# EasyEDA Pro project RUSH_PCB_nova_com_cobre.epro, board PCB1
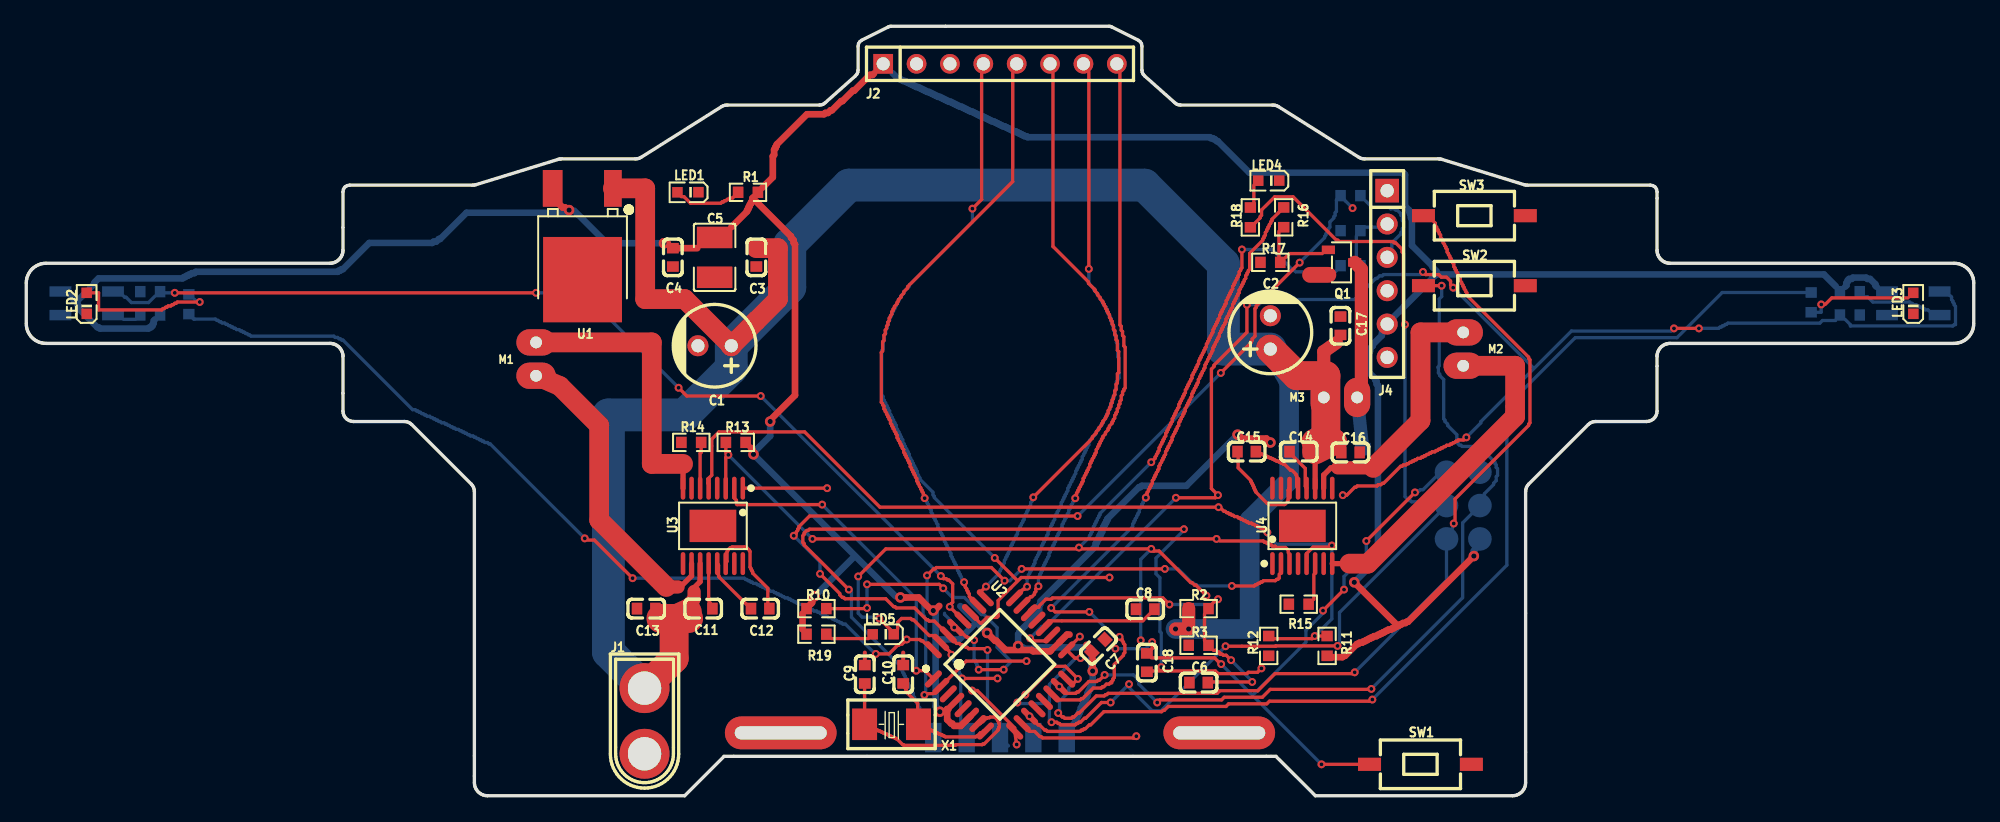
[diagram p1: board, top side]
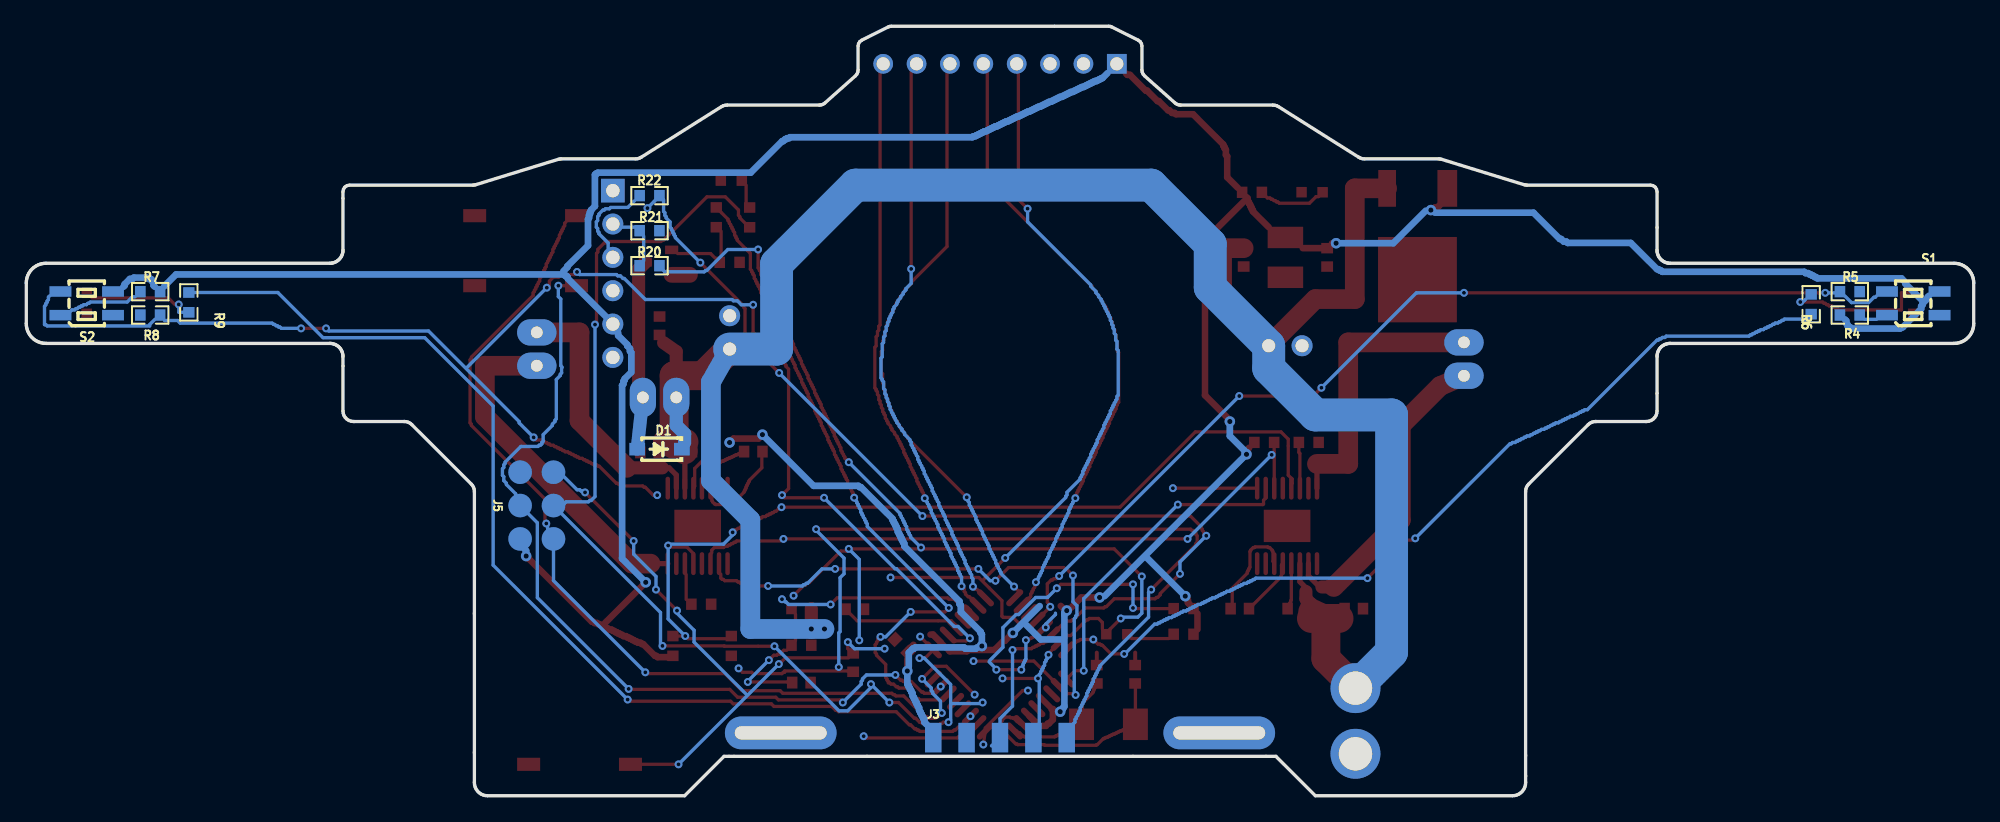
[diagram p2: board, bottom side, seen from below]

Outline 148.2 x 58.6 mm; copper layers: Top Layer, Bottom Layer. Coordinates in mm from the lower left corner of the outline.
Stack: Top Layer 0.035mm / Dielectric1 1.51mm FR4 er 4.5 / Bottom Layer 0.035mm

## Design rules (mm)
spacing copperThickness1oz (default): track to track 0.2, other pairs 0.2 to 0.3
spacing copperThickness2oz: track to track 0.203, other pairs 0.152 to 0.3
spacing Plane_innerPlane: track to track 0.102, other pairs 0.152 to 0.3
spacing Copper_copperRegion: track to track 0.102, other pairs 0.152 to 0.3
track width copperThickness1oz (default): min 0.25, default 0.25, max 3
track width copperThickness2oz: min 0.203, default 0.254, max 2.54
differential pair differentialPair (default): width min 0.127, default 0.254, max 2.54; gap min 0.152, default 0.152

## Placement (name value [footprint] x y rotation side)
C1  220uF  [CAP-TH_BD6.3-P2.50-D1.0-FD]  52.38 34.27 180 top
C2  220uF  [CAP-TH_BD6.3-P2.50-D1.0-FD]  94.67 35.29 90 top
C3  220nF  [C0603]  55.56 41 270 top
C4  100nF  [C0603]  49.2 41 270 top
C5  47uF  [C1210]  52.38 41 90 top
C6  100nF  [C0603]  89.21 8.62 180 top
C7  100nF  [C0603]  81.59 11.41 45 top
C8  100nF  [C0603]  85.15 14.2 180 top
C9  22pF  [C0603]  63.81 9.25 90 top
C10  22pF  [C0603]  66.73 9.25 90 top
C11  100nF  [C0603]  51.51 14.25 0 top
C12  22nF  [C0603]  55.85 14.25 0 top
C13  100nF  [C0603]  47.18 14.25 180 top
C14  100nF  [C0603]  96.83 26.21 180 top
C15  22nF  [C0603]  92.87 26.21 180 top
C16  100nF  [C0603]  100.77 26.14 0 top
C17  100nF  [C0603]  100.01 35.79 90 top
C18  100nF  [C0603]  85.28 10.14 90 top
D1  1N5819  [SOD-123_L2.7-W1.6-LS3.7-RD-1]  100.01 26.4 0 bottom
J1  XT30 (bateria 2S)  [CONN-TH_XT30U-M]  47.05 5.69 270 top
J2  BARRA (1x8, 2,54 mm)  [HDR-TH_8P-P2.54-V-M]  74.1 55.74 0 top
J3  GRAVAÇÃO  [seguidor_alpha:HDR_1x05_P2.54_SMD_DEITADA]  74.1 4.43 0 bottom
J4  BLUETOOTH (femea 1x6, ordem HC-05)  [HDR-TH_6P-P2.54-V-F]  103.56 39.73 270 top
J5  ICSP  [seguidor_alpha:ICSP_6P_SMD_BOT]  109.35 22.1 0 bottom
LED1  verde  [LED0603-RD_GREEN]  50.35 45.96 180 top
LED2  LED A  [LED0603-RD_GREEN]  4.6 37.5 90 top
LED3  LED B  [LED0603-RD_GREEN]  143.6 37.5 90 top
LED4  LED C  [LED0603-RD_GREEN]  94.55 46.84 180 top
LED5  TX  [LED0603-RD_GREEN]  65.21 12.3 180 top
M1  1020 esq.  [seguidor_alpha:MOTOR_1020_2P]  38.79 33.25 0 top
M2  1020 dir.  [seguidor_alpha:MOTOR_1020_2P]  109.35 34.02 180 top
M3  ventoinha  [seguidor_alpha:MOTOR_1020_2P]  100.01 30.33 270 top
NOREF  -  [Pad_e557]  90.78 4.79 270 top
NOREF#2  -  [Pad_e558]  57.41 4.79 270 top
Q1  AO3400A  [SOT-23-3_L2.9-W1.3-P1.90-LS2.4-BR]  100.09 40.62 180 top
R1  1k  [R0603]  54.92 45.95 180 top
R2  20k 1%  [R0603]  89.21 14.25 0 top
R3  10k 1%  [R0603]  89.21 11.46 180 top
R4  220  [R0603]  9.43 36.61 180 bottom
R5  47k  [R0603]  9.43 38.39 180 bottom
R6  1k  [R0603]  12.37 37.43 90 bottom
R7  220  [R0603]  138.77 38.39 0 bottom
R8  47k  [R0603]  138.77 36.61 0 bottom
R9  1k  [R0603]  135.83 37.57 270 bottom
R10  10k  [R0603]  60.13 14.25 0 top
R11  15k 1%  [R0603]  98.99 11.41 90 top
R12  10k 1%  [R0603]  94.55 11.41 270 top
R13  10k  [R0603]  53.99 26.91 180 top
R14  1.5k 1%  [R0603]  50.6 26.91 180 top
R15  1.5k 1%  [R0603]  96.83 14.58 180 top
R16  200  [R0603]  95.69 44.05 270 top
R17  10k  [R0603]  94.67 40.62 180 top
R18  1k  [R0603]  93.15 44.04 90 top
R19  1k  [R0603]  60.13 12.3 0 top
R20  1k  [R0603]  100.77 40.37 0 bottom
R21  2k  [R0603]  100.77 43.03 180 bottom
R22  4.7k  [R0603]  100.77 45.7 0 bottom
S1  QRE1113GR  [OPTO-SMD_QRE1113GR]  4.6 37.5 180 bottom
S2  QRE1113GR  [OPTO-SMD_QRE1113GR]  143.6 37.5 180 bottom
SW1  RESET  [KEY-SMD_L6.1-W3.7-LS8.0-2]  106.1 2.39 180 top
SW2  BOTÃO 1  [KEY-SMD_L6.1-W3.7-LS8.0-2]  110.2 38.84 0 top
SW3  BOTÃO 2  [KEY-SMD_L6.1-W3.7-LS8.0-2]  110.2 44.18 0 top
U1  78M05  [TO-252-2_L6.5-W6.1-P4.58-LS10.0-TL]  42.35 42.78 270 top
U2  ATmega328P-AU  [TQFP-32_L7.0-W7.0-P0.80-LS9.0-BL]  74.1 10 315 top
U3  DRV8874PWPR  [HTSSOP-16_L5.0-W4.4-P0.65-LS6.4-BL-EP]  52.25 20.55 180 top
U4  DRV8874PWPR  [HTSSOP-16_L5.0-W4.4-P0.65-LS6.4-BL-EP]  97.11 20.55 0 top
X1  16MHz  [CRYSTAL-SMD_L5.0-W3.2]  65.84 5.44 0 top

## Footprints (pads in the part's own frame, mm; a bottom-side part is the same pattern mirrored in y, then rotated)
C0603
  rect 0.8x0.9 smd: 1(-0.7,0) 2(0.7,0)
C1210
  rect 1.635x2.7 smd: 1(-1.518,0) 2(1.518,0)
CAP-TH_BD6.3-P2.50-D1.0-FD
  round 1.6 hole 1: 1(-1.27,0) 2(1.27,0)
CONN-TH_XT30U-M
  round 3.8 hole 2.54: 1(-2.5,0) 2(2.5,0)
CRYSTAL-SMD_L5.0-W3.2
  rect 1.9x2.4 smd: 1(-2.05,0) 2(2.05,0)
HDR-TH_6P-P2.54-V-F
  rect 1.8x1.8 hole 1.02: 1(-6.35,0)
  round 1.6 hole 1.02: 2(-3.81,0) 3(-1.27,0) 4(1.27,0) 5(3.81,0) 6(6.35,0)
HDR-TH_8P-P2.54-V-M
  rect 1.5x1.5 hole 1: 1(-8.89,0)
  round 1.5 hole 1: 2(-6.35,0) 3(-3.81,0) 4(-1.27,0) 5(1.27,0) 6(3.81,0) 7(6.35,0) 8(8.89,0)
HTSSOP-16_L5.0-W4.4-P0.65-LS6.4-BL-EP
  oval 0.343x1.746 smd: 1(-2.275,-2.873) 2(-1.625,-2.873) 3(-0.975,-2.873) 4(-0.325,-2.873) 5(0.325,-2.873) 6(0.975,-2.873) 7(1.625,-2.873) 8(2.275,-2.873) 9(2.275,2.873) 10(1.625,2.873) 11(0.975,2.873) 12(0.325,2.873) 13(-0.325,2.873) 14(-0.975,2.873) 15(-1.625,2.873) 16(-2.275,2.873)
  rect 3.55x2.46 smd: 17(0,0)
KEY-SMD_L6.1-W3.7-LS8.0-2
  rect 1.75x1 smd: 1(-3.875,0) 2(3.875,0)
LED0603-RD_GREEN
  rect 0.8x0.8 smd: 1(-0.799,-0.004) 2(0.799,0.004)
OPTO-SMD_QRE1113GR
  rect 1.66x0.8 smd: 1(-2,-0.9) 2(2,-0.9) 3(2,0.9) 4(-2,0.9)
Pad_e557
  oval 2.5x8.5 hole 1x7: 1(0,0)
Pad_e558
  oval 2.5x8.5 hole 1x7: 1(0,0)
R0603
  rect 0.806x0.864 smd: 1(-0.753,0) 2(0.753,0)
seguidor_alpha:HDR_1x05_P2.54_SMD_DEITADA
  rect 1.25x2.25 smd: 1(5.08,0) 2(2.54,0) 3(0,0) 4(-2.54,0) 5(-5.08,0)
seguidor_alpha:ICSP_6P_SMD_BOT
  round 1.8 smd: 1(-1.27,2.54) 2(1.27,2.54) 3(-1.27,0) 4(1.27,0) 5(-1.27,-2.54) 6(1.27,-2.54)
seguidor_alpha:MOTOR_1020_2P
  oval 3x2 hole 0.9: 1(0,-1.27) 2(0,1.27)
SOD-123_L2.7-W1.6-LS3.7-RD-1
  rect 1.2x0.95 smd: 1(-1.7,0) 2(1.7,0)
SOT-23-3_L2.9-W1.3-P1.90-LS2.4-BR
  rect 1x0.65 smd: 1(1,-0.95) 2(1,0.95) 3(-1,0)
TO-252-2_L6.5-W6.1-P4.58-LS10.0-TL
  rect 2.8x1.35 smd: 1(-3.475,2.29)
  rect 6.5x6 smd: 2(3.475,-0.017)
  rect 2.8x1.5 smd: 3(-3.475,-2.29)
TQFP-32_L7.0-W7.0-P0.80-LS9.0-BL
  oval 0.45x1.65 smd: 1(-2.8,-4.369) 2(-2,-4.369) 3(-1.2,-4.369) 4(-0.4,-4.369) 5(0.4,-4.369) 6(1.2,-4.369) 7(2,-4.369) 8(2.8,-4.369) 17(2.8,4.369) 18(2,4.369) 19(1.2,4.369) 20(0.4,4.369) 21(-0.4,4.369) 22(-1.2,4.369) 23(-2,4.369) 24(-2.8,4.369)
  oval 1.65x0.45 smd: 9(4.381,-2.8) 10(4.381,-2) 11(4.381,-1.2) 12(4.381,-0.4) 13(4.381,0.4) 14(4.381,1.2) 15(4.381,2) 16(4.381,2.8) 25(-4.381,2.8) 26(-4.381,2) 27(-4.381,1.2) 28(-4.381,0.4) 29(-4.381,-0.4) 30(-4.381,-1.2) 31(-4.381,-2) 32(-4.381,-2.8)

## Nets
As in the schematic.

Pads without a net: J2 3; J4 1 6; NOREF 1; NOREF#2 1; U2 12 13; U3 4; U4 4

## Via types
v1: diameter 0.8, hole 0.4, Top Layer to Bottom Layer, 17 vias
v2: diameter 0.6, hole 0.3, Top Layer to Bottom Layer, 119 vias

## Routing (per net, layer and track width the routed paths; a pad name or vN(x,y) marks a point on that pad's centre or on a via; arc(x,y) is an arc through that point)
+5V: length 317.5
  Top Layer w0.5: 79.39,12.27 79.2,12.27 U2.18 ; 78.02,11.1 77.92,11 76.62,11 76.52,11.1 74.52,11.1 73.82,11.8 73.72,11.8 v1(73.12,12.4) ; 70.59,5.32 71.11,5.32 U2.6 ; 49.55,41.7 51.05,41.7 ; 70.18,6.6 70.08,6.6 70.08,5.8 70.38,5.5 70.48,5.5 ; v1(110.16,18.25) 105.16,13.25 105.06,13.25 104.96,13.15 104.76,13.15 104.66,13.05 104.56,13.05 104.46,12.95 104.36,12.95 104.26,12.85 104.16,12.85 104.06,12.75 103.96,12.75 103.86,12.65 103.66,12.65 103.56,12.55 103.46,12.55 103.36,12.45 103.26,12.45 103.16,12.35 103.06,12.35 102.96,12.25 102.86,12.25 102.76,12.15 102.56,12.15 102.46,12.05 102.36,12.05 102.26,11.95 102.16,11.95 102.06,11.85 101.96,11.85 101.86,11.75 101.76,11.75 101.66,11.65 101.46,11.65 101.36,11.55 101.26,11.55 100.36,10.65 100.26,10.65 100.16,10.55 99.09,10.55 R11.1 ; 56.8,28.8 58.5,30.5 58.5,42 58.4,42.1 58.4,42.3 58.2,42.5 58.2,42.6 55.5,45.3 ; v1(94.68,26.9) 94.38,27.2 92.48,27.2 v1(92.18,27.5) ; 55.35,45.6 55.25,45.5 55.25,45.3 55.16,45.2 55.16,45.1 55.06,45 55.06,44.9 54.95,44.8 54.95,44.7 54.85,44.6 54.85,44.5 53.66,43.3 ; C7.1 81.1,11.08 80.69,11.49 ; 68.71,14.3 67.91,15.1 v1(66.52,15.1) ; U1.3 40.06,45.55 40.81,44.8 41.01,44.8 41.11,44.7 41.21,44.7 v1(41.31,44.6) ; 59.07,13.87 59.07,12.67 ; 69.47,14.45 69.12,14.1 v1(69.02,14.1) ; 81.15,10.4 v1(81.15,9.5) ; v1(101.06,16.25) 104.16,13.15 ; v1(55.34,26) 55.34,26.1 55.24,26.2 55.24,26.4 55.14,26.5 ; R10.1 59.38,14.28 59.8,14.7 59.8,14.9 59.9,15 59.9,15.1 v1(60,15.2) ; 48.82,42.08 v1(48.52,42.08) ; 64.51,55 64.41,54.9 64.21,54.9 63.01,53.7 62.91,53.7 62.11,52.9 62.01,52.9 61.31,52.2 61.21,52.2 61.01,52 60.81,52 60.71,51.9 59.41,51.9 57.11,49.6 57.11,49.5 57.01,49.4 57.01,49.3 56.91,49.2 56.91,48.8 56.81,48.7 56.81,47.1 56.01,46.3
  Bottom Layer w0.5: 41,44.4 33.5,44.4 31.5,42.4 31.4,42.4 31.2,42.2 31,42.2 30.9,42.1 26.1,42.1 24.1,40.1 24,40.1 23.9,40 23.8,40 23.7,39.9 12.9,39.9 12.8,39.8 12.6,39.8 12.5,39.7 12.4,39.7 12.3,39.6 12.2,39.6 12.1,39.5 12,39.5 11.9,39.4 5.5,39.4 5.2,39.1 5.2,39 4,37.8 ; J3.1 79.18,4.93 79.85,5.6 79.85,5.8 79.95,5.9 79.95,6 80.05,6.1 80.05,6.2 80.15,6.3 80.15,6.4 80.25,6.5 80.25,6.7 80.35,6.8 80.35,6.9 80.45,7 80.45,7.1 80.55,7.2 80.55,7.3 80.65,7.4 80.65,7.5 80.75,7.6 80.75,7.8 80.85,7.9 80.85,8 80.95,8.1 80.95,8.2 81.05,8.3 81.05,8.4 81.15,8.5 v1(81.15,9.5) ; v1(110.16,18.25) 110.16,18.65 110.26,18.75 ; 103.16,35.25 103.16,35.05 102.46,34.35 102.46,34.25 102.26,34.05 102.26,33.85 102.16,33.75 102.16,32.25 102.66,31.75 102.66,31.65 102.76,31.55 102.76,31.35 102.86,31.25 102.86,18.05 v1(101.06,16.25) ; v1(56.61,28.5) 56.61,27.4 55.34,26.13 v1(55.34,26) 66.14,15.2 ; 107.32,39.95 107.03,40.25 107.03,40.33 105.45,41.9 105.45,43.92 105.38,44 105.38,44.22 105.3,44.3 105.3,44.45 105.22,44.53 105.22,44.6 104.92,44.9 104.92,47.3 104.85,47.38 104.78,47.38 104.7,47.45 93.07,47.45 90.67,49.85 90.6,49.85 90.45,50 90.38,50 90.3,50.08 90.15,50.08 90.07,50.15 76.2,50.15 76.12,50.22 75.97,50.22 75.9,50.3 75.82,50.3 75.75,50.38 75.67,50.38 75.6,50.45 75.53,50.45 75.45,50.53 75.38,50.53 75.3,50.6 75.15,50.6 75.07,50.67 75,50.67 74.92,50.75 74.85,50.75 74.78,50.83 74.7,50.83 74.62,50.9 74.55,50.9 74.47,50.97 74.32,50.97 74.25,51.05 74.17,51.05 74.1,51.12 74.03,51.12 73.95,51.2 73.88,51.2 73.8,51.28 73.72,51.28 73.65,51.35 73.5,51.35 73.42,51.42 73.35,51.42 73.28,51.5 73.2,51.5 73.12,51.58 73.05,51.58 72.97,51.65 72.9,51.65 72.82,51.72 72.67,51.72 72.6,51.8 72.53,51.8 72.45,51.88 72.38,51.88 72.3,51.95 72.22,51.95 72.15,52.03 72.07,52.03 72,52.1 71.85,52.1 71.78,52.17 71.7,52.17 71.62,52.25 71.55,52.25 71.47,52.33 71.4,52.33 71.32,52.4 71.25,52.4 71.17,52.47 71.03,52.47 70.95,52.55 70.88,52.55 70.8,52.62 70.72,52.62 70.65,52.7 70.57,52.7 70.5,52.78 70.42,52.78 70.35,52.85 70.2,52.85 70.12,52.92 70.05,52.92 69.97,53 69.9,53 69.82,53.08 69.75,53.08 69.67,53.15 69.6,53.15 69.53,53.22 69.38,53.22 69.3,53.3 69.22,53.3 69.15,53.38 69.07,53.38 69,53.45 68.92,53.45 68.85,53.53 68.78,53.53 68.7,53.6 68.55,53.6 68.47,53.67 68.4,53.67 68.32,53.75 68.25,53.75 68.17,53.83 68.1,53.83 68.03,53.9 67.95,53.9 67.88,53.97 67.72,53.97 67.65,54.05 67.57,54.05 67.5,54.12 67.42,54.12 67.35,54.2 67.28,54.2 67.2,54.28 67.12,54.28 67.05,54.35 66.97,54.35 66.9,54.42 66.75,54.42 66.67,54.5 66.6,54.5 66.53,54.58 66.45,54.58 66.38,54.65 66.3,54.65 65.92,55.03 ; v1(92.18,27.5) 88.28,23.6 84.88,23.6 84.78,23.5 84.68,23.5 82.28,21.1 82.28,21 82.18,20.9 82.18,20.8 82.08,20.7 82.08,20.6 81.98,20.5 81.98,20.4 81.88,20.3 81.88,20.1 81.78,20 81.78,19.9 81.68,19.8 81.68,19.7 81.58,19.6 81.58,19.5 81.48,19.4 81.48,19.3 81.38,19.2 81.38,19 77.18,14.8 77.18,14.6 77.08,14.5 77.08,14 75.58,12.5 75.58,12.4 75.48,12.3 v1(75.48,11.4) ; 41.7,44.55 44.17,42.08 v1(48.52,42.08) ; 137.7,38.8 136.8,39.7 107.3,39.7 107.2,39.6 107.1,39.6 107,39.5 107,39.4 104.1,36.5 ; 81.04,9.8 81.04,10.9 80.74,11.2 80.64,11.2 80.54,11.3 76.84,11.3 76.74,11.2 75.94,11.2 75.84,11.3 ; 9.8,36.28 9.7,36.18 9.7,35.98 9.6,35.88 9.6,35.78 9.5,35.68 9.4,35.68 9.3,35.58 5.6,35.58 5.5,35.68 5.4,35.68 4,37.08 4,37.28 3.9,37.38 3.9,37.48 3.5,37.88 3.5,37.98 3.4,38.08 ; 138.41,38.76 138.51,38.86 138.51,39.06 138.61,39.16 138.61,39.26 138.71,39.36 138.91,39.36 139.01,39.46 140.01,39.46 140.11,39.36 140.31,39.36 140.71,38.96 140.71,38.86 140.81,38.76 ; 69.5,11.9 71,11.9 72.1,13 ; v1(69.02,14.1) 69.2,13.92 69.2,6.8 69.3,6.7 69.3,6.62 v1(69.52,6.4) ; v1(73.12,12.4) 71.08,14.44 ; 62.9,18.1 v1(60,15.2)
GND: length 3.3
  Top Layer w0.3: C9.2 63.81,10.9 ; C10.2 66.73,10.9
  Top Layer w1.2: Q1.2 97.7,39.67
VBAT: length 190.9
  Top Layer w0.4: 50.82,15.55 50.82,15.84 51.28,16.3 U3.11 ; U4.11 98.08,25.6
  Top Layer w1: 50.4,14 50.4,14.58 50.82,15 50.82,15.55 ; R2.1 v1(88.46,12.7) v1(87.46,12.7) ; 99.7,34.5 98.74,33.82 M3.1 98.9,31.99
  Top Layer w1.5: U1.1 47.1,46.25 47.1,37.82 50.1,37.82 C1.1 57.2,37.82 57.2,41.7 55.56,41.7
  Top Layer w2: 98.1,26.25 99.5,26.95 98.05,26.95 ; 50.4,14 49.3,13.5
  Top Layer w2.2: 49.3,13.5 49.3,10.45 J1.1 ; 98.9,27.05 98.9,31.99 96.7,31.99 C2.1 ; 48.3,13.5 50.4,13.5
  Bottom Layer w1: 98.1,26.9 98.1,27.56 98.74,28.2 M3.1
  Bottom Layer w1.5: C2.1 96.1,31.5 96.1,24 93.1,21 93.1,12.7 v1(88.46,12.7) v1(87.46,12.7)
  Bottom Layer w2.5: C2.1 91.1,34.02 91.1,40.5 85.1,46.5 62.6,46.5 58.1,42 58.1,38.72 C1.1 53.65,32.55 50.1,29 44.3,29 44.3,10.94 J1.1
VBAT_A7: length 24.6
  Top Layer w0.25: v2(93.29,8.67) 89.96,8.67 C6.1 ; 77.09,14.47 77.59,14.97 77.99,14.97 78.09,15.07 86.49,15.07 v2(86.99,14.57) ; v2(90.69,14.97) 90.59,14.97 90.29,14.67 ; 89.66,13.83 89.66,11.83 ; 90.34,11.08 90.56,11.08 90.71,10.92 90.79,10.92 90.79,10.85 90.86,10.85 90.86,10.78 91.01,10.78 91.09,10.7 91.31,10.7 v2(91.69,10.33) ; U2.22 76.34,14.12 76.57,14.35 77.06,14.35
  Bottom Layer w0.25: 93.11,8.9 v2(91.69,10.33) ; v2(86.99,14.57) 90.19,14.57 90.39,14.77 90.49,14.77
AREF: length 9.1
  Top Layer w0.25: U2.20 77.47,12.99 77.8,13.32 84.97,13.32 C8.1
B1_D11: length 64.1
  Top Layer w0.25: v2(86.06,7.1) 86.26,7.3 90.96,7.3 91.16,7.5 94.06,7.5 94.66,8.1 102.32,8.1 v2(102.36,8.14) ; SW2.1 v2(107.71,38.84) ; v2(82.06,9.2) 81.66,8.8 81.56,8.8 81.46,8.7 80.86,8.7 80.06,7.9 79.96,7.9 79.86,7.8 79.16,7.8
  Bottom Layer w0.25: 107.41,32.63 107.53,32.74 107.53,37.83 107.71,38.01 v2(107.71,38.84) ; 107.46,32.6 107.46,32.2 107.56,32.1 107.56,32 107.86,31.7 107.86,28.7 107.96,28.6 107.96,28.5 108.16,28.3 108.16,28.2 108.86,27.5 108.86,27 108.96,26.9 108.96,26.8 109.06,26.7 109.16,26.7 109.26,26.6 110.56,26.6 111.76,25.4 111.76,25.3 111.86,25.2 111.86,25 111.96,24.9 111.96,24.4 111.86,24.3 111.86,24 111.66,23.8 111.66,23.7 110.96,23 110.96,22.44 J5.4 109.31,20.79 109.31,15.08 v2(102.36,8.14) ; v2(82.06,9.2) 84.26,9.2 84.56,8.9 84.56,8.8 84.66,8.7 84.66,8.5 v2(86.06,7.1)
  vias: v2(78.61,8.32)
B2_D12: length 74.7
  Top Layer w0.25: v2(76.03,7.7) 78.19,9.86 79.07,9.86 v2(80.03,8.9) 79.73,8.6 ; 108.73,21 108.73,22.6 114.33,28.2 114.33,28.3 114.43,28.4 114.43,33.2 114.33,33.3 114.33,33.4 109.63,38.1 109.63,38.3 109.53,38.4 109.53,38.5 109.43,38.6 109.43,38.7 109.33,38.8 109.33,38.9 109.23,39 109.23,39.1 109.13,39.2 109.13,39.4 109.03,39.5 109.03,39.6 108.93,39.7 108.93,39.8 108.83,39.9 108.83,40 108.73,40.1 108.73,40.2 108.63,40.3 108.63,40.5 108.53,40.6 108.53,40.7 108.43,40.8 108.43,40.9 108.33,41 108.33,41.1 108.23,41.2 108.23,41.3 108.13,41.4 108.13,41.6 108.03,41.7 108.03,41.8 107.93,41.9 107.93,42 107.83,42.1 107.83,42.2 107.73,42.3 107.73,42.4 107.63,42.5 107.63,42.7 107.53,42.8 107.53,42.9 107.43,43 107.43,43.1 107.33,43.2 107.33,43.3 107.23,43.4 107.23,43.6 107.13,43.7 ; v2(101.09,9.4) 100.99,9.3 95.03,9.3 93.73,8 90.83,8 90.63,7.8 82.33,7.8 82.23,7.7 82.13,7.7 82.03,7.6 81.43,7.6 80.13,6.3 80.03,6.3 79.73,6 79.63,6 79.53,5.9 79.03,5.9 78.93,6 78.83,6 v2(78.53,6.3)
  Bottom Layer w0.25: v2(108.63,20.73) 108.53,20.63 108.53,20.33 ; v2(80.03,8.9) 79.33,8.2 79.33,8 79.23,7.9 79.23,7.8 78.63,7.2 78.63,6.4 v2(78.53,6.3) ; J5.1 108.08,16.39 v2(101.09,9.4)
BT_RXD: length 2.8
  Bottom Layer w0.25: 102.82,43.3 101.92,43.3 ; 101.22,42.63 101.22,40.73
BT_TXD: length 6.2
  Bottom Layer w0.25: 103.92,41.7 103.92,42.1 104.62,42.8 104.62,42.9 104.72,43 104.72,43.2 104.82,43.3 104.82,43.7 104.72,43.8 104.72,44.1 104.62,44.2 104.62,44.3 104.32,44.6 104.22,44.6 104.12,44.7 103.82,44.7 103.72,44.8 102.42,44.8 101.92,45.3
C0_A4: length 58.2
  Top Layer w0.25: v2(82.43,16.62) 75.71,16.62 73.96,14.86 73.96,13.67 73.86,13.58 73.11,13.58 72.66,13.13 ; 72.7,55.01 72.7,45.41 v2(72,44.71) ; v2(73.7,18.11) 75.4,16.41 ; 72.6,13.14 72.4,13.34
  Bottom Layer w0.25: v2(72,44.71) 72,43.71 67.2,38.91 67.2,38.81 66.8,38.41 66.8,38.31 66.6,38.11 66.6,38.01 66.4,37.81 66.4,37.71 66.3,37.61 66.3,37.51 66.2,37.41 66.2,37.31 66.1,37.21 66.1,37.11 66,37.01 66,36.91 65.9,36.81 65.9,36.71 65.8,36.61 65.8,36.51 65.7,36.41 65.7,36.21 65.6,36.11 65.6,35.91 65.5,35.81 65.5,35.61 65.4,35.51 65.4,35.21 65.3,35.11 65.3,34.71 65.2,34.61 65.2,34.01 65.1,33.91 65.1,30.51 65.2,30.41 65.2,30.21 65.3,30.11 65.3,30.01 65.4,29.91 65.4,29.81 65.5,29.71 65.5,29.61 65.6,29.51 65.6,29.41 65.7,29.31 65.7,29.11 65.8,29.01 65.8,28.91 65.9,28.81 65.9,28.71 66,28.61 66,28.51 66.1,28.41 66.1,28.31 66.2,28.21 66.2,28.01 66.3,27.91 66.3,27.81 66.4,27.71 66.4,27.61 66.5,27.51 66.5,27.41 66.6,27.31 66.6,27.21 66.7,27.11 66.7,26.91 66.8,26.81 66.8,26.71 66.9,26.61 66.9,26.51 67,26.41 67,26.31 67.1,26.21 67.1,26.11 67.2,26.01 67.2,25.81 67.3,25.71 67.3,25.61 67.4,25.51 67.4,25.41 67.5,25.31 67.5,25.21 67.6,25.11 67.6,25.01 67.7,24.91 67.7,24.81 67.8,24.71 67.8,24.51 67.9,24.41 67.9,24.31 68,24.21 68,24.11 69,23.11 69,22.91 69.1,22.81 69.1,22.71 v2(73.7,18.11)
CPH_A: length 4.5
  Top Layer w0.25: 52.58,17.68 52.58,17.7 52.63,17.65 52.63,17.6 52.68,17.55 52.68,16.75 52.73,16.7 52.73,16.65 55.13,14.25 C12.1
CPH_B: length 4.9
  Top Layer w0.25: C15.1 93.57,26.22 93.62,26.17 93.72,26.17 93.77,26.12 93.82,26.12 93.87,26.07 93.92,26.07 93.97,26.02 94.02,26.02 94.07,25.97 94.17,25.97 94.22,25.92 94.27,25.92 94.32,25.87 94.37,25.87 94.42,25.82 94.47,25.82 94.52,25.77 94.57,25.77 94.62,25.72 94.72,25.72 94.77,25.67 94.82,25.67 94.87,25.62 94.92,25.62 94.97,25.57 95.02,25.57 95.07,25.52 95.12,25.52 95.17,25.47 95.27,25.47 95.32,25.42 95.37,25.42 95.42,25.37 95.47,25.37 95.52,25.32 95.57,25.32 95.62,25.27 95.67,25.27 95.72,25.22 95.77,25.22 96.22,24.77 96.32,24.77 96.62,24.47 96.62,24.42 96.67,24.37 96.67,23.57 96.72,23.52 96.72,23.47 96.77,23.42 U4.13
CPL_A: length 8
  Top Layer w0.25: C12.2 56.53,14.25 56.48,14.3 56.48,14.4 56.43,14.45 56.43,15.8 55.28,16.95 55.28,17.05 55.23,17.1 55.23,17.15 55.18,17.2 55.18,17.25 55.13,17.3 55.13,17.35 55.08,17.4 55.08,18.6 55.03,18.65 55.03,18.7 54.83,18.9 54.73,18.9 54.68,18.95 53.73,18.95 53.68,18.9 53.58,18.9 53.38,18.7 53.38,18.65 53.33,18.6 53.33,17.85 53.28,17.8 53.28,17.75 53.23,17.7 U3.14
CPL_B: length 7.7
  Top Layer w0.25: U4.14 96.12,23.42 96.07,23.37 96.07,23.32 96.02,23.27 96.02,22.47 95.97,22.42 95.97,22.37 95.82,22.22 95.77,22.22 95.72,22.17 94.62,22.17 94.57,22.22 94.52,22.22 94.47,22.27 94.42,22.27 93.57,23.12 93.57,23.17 93.52,23.22 93.52,23.27 93.47,23.32 93.47,23.37 93.42,23.42 93.42,23.52 93.37,23.57 93.37,23.62 93.32,23.67 93.32,23.72 93.27,23.77 93.27,23.82 93.22,23.87 93.22,23.92 93.17,23.97 93.17,24.02 92.22,24.97 92.22,26.17 92.17,26.22 C15.2
DIRA_D3: length 25
  Top Layer w0.25: U3.2 53.88,22.67 54.04,22.5 54.04,22.22 54.1,22.17 v2(60.57,22.17) ; v2(67.73,9.52) 68.4,9.52 69.03,8.89
  Bottom Layer w0.25: v2(67.73,9.52) 67.73,15.01 v2(60.57,22.17)
DIRB_D4: length 46.3
  Top Layer w0.25: U2.2 71.53,10.25 v2(76.12,10.25) ; v2(74.45,16.38) 73.45,17.38 69.25,17.38 69.15,17.28 69.05,17.28 v2(68.55,16.78) ; v2(91.75,15.98) 93.45,15.98 93.55,16.08 93.65,16.08 93.75,16.18 93.85,16.18 93.95,16.28 94.05,16.28 94.15,16.38 95.05,16.38 95.15,16.48 95.25,16.48 95.35,16.58 95.35,16.88 ; v2(68.35,7.68) 68.45,7.78 69.05,7.78 ; v2(75.75,17.28) v2(86.65,17.28)
  Bottom Layer w0.25: v2(86.65,17.28) 87.65,17.28 88.75,16.18 88.85,16.18 88.95,16.08 89.05,16.08 89.15,15.98 v2(91.75,15.98) ; v2(68.55,16.78) 68.55,14.78 68.25,14.48 68.25,13.78 68.35,13.68 68.35,13.58 68.45,13.48 68.45,7.78 v2(68.35,7.68) ; v2(74.45,16.38) 74.85,16.38 v2(75.75,17.28)
DRV_SLEEP: length 49.1
  Top Layer w0.25: R13.2 53.24,26.15 v2(53.43,25.96) 53.23,25.76 U3.3 ; 96.03,18.5 96.03,18.7 95.83,18.9 95.13,18.9 95.03,19 94.83,19 94.73,19.1 94.63,19.1 94.53,19.2 94.43,19.2 94.33,19.3 94.23,19.3 94.13,19.4 90.83,19.4 ; v2(90.58,19.56) v2(59.83,19.56)
  Bottom Layer w0.25: v2(53.43,25.96) v2(59.83,19.56)
DTR: length 69.3
  Top Layer w0.25: 86.37,9.6 v2(86.37,9.8) ; C18.1 85.34,9.5 90.5,9.5 90.5,9.4 90.59,9.4 90.69,9.3 92.89,9.3 93,9.4 93.69,9.4 v2(94,9.7) ; v2(88.09,20.3) 59.59,20.3 59.5,20.2 59.39,20.2 59.19,20 59.19,19.9 59.09,19.8 59.09,19.3 59.19,19.2 59.19,19.1 v2(62.59,15.7)
  Bottom Layer w0.25: J3.5 69.02,4.97 68.39,5.6 68.39,5.8 68.29,5.9 68.29,6 68.19,6.1 68.19,6.2 68.09,6.3 68.09,6.4 68,6.5 68,6.7 67.89,6.8 67.89,6.9 67.79,7 67.79,7.1 67.69,7.2 67.69,7.3 67.59,7.4 67.59,7.5 67.5,7.6 67.5,7.8 67.39,7.9 67.39,8 67.29,8.1 67.29,8.2 67.19,8.3 67.19,8.4 67.09,8.5 67.09,8.6 67,8.7 67,8.9 66.89,9 66.89,9.1 66.79,9.2 66.79,9.3 66.69,9.4 66.69,9.5 66.59,9.6 66.59,9.7 66.5,9.8 66.5,9.9 62.79,13.6 62.79,15.5 v2(62.59,15.7) ; 87.97,20.1 85.97,18.1 85.97,16.9 86.27,16.6 86.27,12.5 86.37,12.4 v2(86.37,9.8)
IPROPI_A: length 3.5
  Top Layer w0.25: U3.6 51.28,26.07 51.36,26.15 R14.1
IPROPI_B: length 1.9
  Top Layer w0.25: 97.98,14.95 97.98,16.85
LEDA_D2: length 66.8
  Top Layer w0.25: v2(64.65,10.8) 65.65,10.8 66.3,11.45 66.35,11.45 66.4,11.5 66.45,11.5 66.5,11.55 66.65,11.55 v2(67,11.9) 68,11.9 68.1,11.8 68.2,11.8 68.4,11.6 ; v2(46.14,16.57) 43.24,19.47 42.74,19.47
  Bottom Layer w0.25: v2(46.14,16.57) 54.64,16.57 54.74,16.47 54.84,16.47 54.94,16.37 55.04,16.37 55.14,16.27 55.24,16.27 55.34,16.17 55.54,16.17 55.64,16.07 55.74,16.07 55.84,15.97 55.94,15.97 56.04,15.87 56.14,15.87 56.24,15.77 56.34,15.77 56.44,15.67 56.54,15.67 56.64,15.57 56.84,15.57 56.94,15.47 57.04,15.47 57.14,15.37 57.24,15.37 57.34,15.27 57.44,15.27 57.54,15.17 57.64,15.17 57.74,15.07 57.94,15.07 58.04,14.97 58.14,14.97 58.24,14.87 58.34,14.87 58.44,14.77 58.54,14.77 58.64,14.67 58.74,14.67 58.84,14.57 59.04,14.57 59.14,14.47 59.24,14.47 59.34,14.37 59.44,14.37 59.54,14.27 59.64,14.27 59.74,14.17 59.84,14.17 59.94,14.07 60.14,14.07 60.24,13.97 60.34,13.97 60.44,13.87 60.54,13.87 60.64,13.77 60.74,13.77 60.84,13.67 60.94,13.67 61.04,13.57 61.24,13.57 61.34,13.47 61.44,13.47 61.54,13.37 61.64,13.37 61.74,13.27 61.84,13.27 61.94,13.17 62.04,13.17 62.14,13.07 62.34,13.07 64.44,10.97 ; R6.1 12.75,36.3 14.4,36.3 14.5,36.2 14.6,36.2 14.7,36.1 14.8,36.1 14.9,36 15.1,36 15.2,35.9 15.3,35.9 15.4,35.8 15.5,35.8 15.6,35.7 15.7,35.7 15.8,35.6 15.9,35.6 16,35.5 16.2,35.5 16.3,35.4 16.4,35.4 16.5,35.3 16.6,35.3 16.7,35.2 16.8,35.2 16.9,35.1 17,35.1 17.1,35 23.4,35 23.5,34.9 23.7,34.9 23.8,34.8 23.9,34.8 24,34.7 24.1,34.7 29.4,29.4 29.6,29.4 29.7,29.3 29.8,29.3 29.9,29.2 30,29.2 30.1,29.1 30.2,29.1 30.3,29 30.4,29 30.5,28.9 30.7,28.9 30.8,28.8 30.9,28.8 31,28.7 31.1,28.7 31.2,28.6 31.3,28.6 31.4,28.5 31.5,28.5 31.6,28.4 31.8,28.4 31.9,28.3 32,28.3 32.1,28.2 32.2,28.2 32.3,28.1 32.4,28.1 32.5,28 32.6,28 32.7,27.9 32.9,27.9 33,27.8 33.1,27.8 33.2,27.7 33.3,27.7 33.4,27.6 33.5,27.6 33.6,27.5 33.7,27.5 33.8,27.4 34,27.4 34.1,27.3 34.2,27.3 34.3,27.2 34.4,27.2 34.5,27.1 34.6,27.1 34.7,27 34.8,27 34.9,26.9 35.1,26.9 35.2,26.8 35.3,26.8 v2(42.5,19.6)
LEDB_D7: length 80.1
  Top Layer w0.25: 76.9,5.5 77,5.4 77.1,5.4 77.5,5 77.6,5 77.7,4.9 80.2,4.9 80.3,5 80.4,5 80.5,5.1 80.6,5.1 80.9,5.4 81,5.4 82,6.4 86.4,6.4 86.5,6.5 86.6,6.5 86.9,6.8 91.3,6.8 91.5,7 94.4,7 94.6,7.2 102.2,7.2 102.33,7.33 v2(102.44,7.33)
  Bottom Layer w0.25: R9.1 129.05,38.32 125.62,34.89 117.88,34.89 112.67,29.68 112.67,17.56 v2(102.44,7.33)
  vias: v2(76.35,6.05)
LEDC_D13: length 88
  Top Layer w0.25: v2(104.92,35.88) 104.8,36 104.8,41.31 104.7,41.41 104.7,41.61 104.2,42.11 104.1,42.11 104,42.21 99.9,42.21 99.8,42.31 99.7,42.31 96.4,45.61 95,45.61 94,44.61 94,44.21 93.9,44.11 93.9,44.01 93.5,43.61 ; v2(91.26,11.39) 95.06,11.39 95.09,11.41 v2(99.79,11.41) ; v2(80.18,12.12) 79.17,11.11 79.79,10.48 v2(80.23,10.48) ; v2(78.02,5.6) 78.42,5.6 78.52,5.5 78.62,5.5 78.72,5.4 79.82,5.4 79.92,5.5 80.02,5.5 80.12,5.6 80.22,5.6 80.52,5.9 80.62,5.9 81.82,7.1 v2(82.52,7.1)
  Bottom Layer w0.25: v2(80.23,10.48) 79.86,10.48 77.86,8.48 77.86,7.02 ; v2(104.92,35.88) 104.92,22.78 105.22,22.48 105.32,22.48 105.42,22.38 107.12,22.38 107.41,22.1 J5.3 99.93,13.95 99.93,11.56 v2(99.79,11.41) ; v2(78.02,5.6) 77.86,5.76 77.86,7.02 ; v2(91.26,11.39) 86.35,6.47 85.69,6.47 83.92,8.24 v2(83.92,8.5) v2(82.52,7.1) ; 77.86,7.02 75.5,7.02 v2(75.42,7.1)
MARK_L_A5: length 75.6
  Top Layer w0.25: v2(49.64,31.07) 50.27,30.44 v2(55.89,30.44) ; v2(69.6,16.73) 69.8,16.53 70,16.53 70.1,16.43 70.2,16.43 70.5,16.13 70.5,14.73 70.28,14.51 v2(70.28,14.39) 71.28,13.38 ; v2(11.3,38.3) v2(38.79,38.3)
  Bottom Layer w0.25: v2(49.64,31.07) 42.41,38.3 v2(38.79,38.3) ; 9.8,38.06 9.3,37.56 8,37.56 7.6,37.96 7.5,37.96 7.4,38.06 ; v2(69.6,16.73) v2(55.89,30.44) ; R5.1 10.27,38.3 v2(11.3,38.3)
MARK_R_A6: length 116.5
  Top Layer w0.25: v2(108.59,38.69) 108.39,38.89 108.39,39.19 108.09,39.49 107.69,39.49 107.49,39.69 106.49,39.69 v2(106.29,39.89) ; v2(109.59,27.29) 109.39,27.09 108.99,27.09 108.89,26.99 108.79,26.99 108.69,26.89 108.59,26.89 108.49,26.79 108.39,26.79 108.29,26.69 108.09,26.69 107.99,26.59 107.89,26.59 107.79,26.49 107.69,26.49 107.59,26.39 107.49,26.39 107.39,26.29 107.29,26.29 107.19,26.19 106.99,26.19 106.89,26.09 106.79,26.09 106.69,25.99 106.59,25.99 106.49,25.89 106.39,25.89 106.29,25.79 106.19,25.79 106.09,25.69 105.89,25.69 105.79,25.59 105.69,25.59 105.59,25.49 105.49,25.49 105.39,25.39 105.29,25.39 105.19,25.29 105.09,25.29 104.99,25.19 104.79,25.19 104.69,25.09 104.59,25.09 103.29,23.79 103.19,23.79 103.09,23.69 102.89,23.69 102.79,23.59 101.29,23.59 101.19,23.49 101.09,23.49 100.49,22.89 v2(100.19,22.89) ; v2(92.89,37.39) 92.89,35.29 90.39,32.79 90.39,32.69 90.19,32.49 90.19,23.39 90.49,23.09 ; v2(76.39,11.99) 76.49,11.99 76.69,11.79 77.59,11.79 U2.19 ; v2(127.29,35.59) v2(125.39,35.59) ; v2(87.49,22.69) 90.49,22.69 v2(90.69,22.89)
  Bottom Layer w0.25: v2(127.29,35.59) 128.79,35.59 128.89,35.69 128.99,35.69 129.09,35.79 129.19,35.79 129.29,35.89 129.39,35.89 129.49,35.99 136.49,35.99 136.69,36.19 137.69,36.19 ; v2(125.39,35.59) 125.19,35.39 117.59,35.39 110.69,28.49 110.69,28.39 v2(109.59,27.29) ; 114.69,32.59 v2(108.59,38.69) ; 138.41,36.28 138.81,35.88 138.81,35.78 146.61,35.78 146.71,35.88 146.81,35.88 146.81,37.28 146.71,37.38 146.71,37.48 146.61,37.58 146.61,37.68 146.51,37.78 146.51,37.98 146.41,38.08 ; v2(106.29,39.89) 106.09,39.69 103.29,39.69 103.19,39.59 102.99,39.59 102.79,39.39 102.69,39.39 101.09,37.79 94.49,37.79 94.39,37.69 94.09,37.69 93.79,37.39 v2(92.89,37.39) ; v2(87.49,22.69) 82.09,17.29 81.99,17.29 77.59,12.89 77.29,12.89 v2(76.39,11.99)
OUT_A1: length 22.3
  Top Layer w0.4: 49.98,23.42 49.98,25.27
  Top Layer w1.5: 49.98,25.27 47.6,25.27 47.6,34.52 M1.2
OUT_A2: length 23.8
  Top Layer w0.4: 49.6,15.9 49.78,15.9 50.63,16.75 U3.10
  Top Layer w1: 49.6,15.9 48.7,15.9
  Top Layer w1.5: 48.7,15.9 43.6,21 43.6,28.2 40.6,31.2 M1.1
OUT_B1: length 26.4
  Top Layer w0.4: U4.8 100.7,17.68
  Top Layer w1.5: 100.7,17.68 102.1,17.68 113.3,28.88 113.3,32.75 M2.2
OUT_B2: length 20.1
  Top Layer w0.4: U4.10 98.73,24.42 99.28,24.97 99.8,24.97
  Top Layer w1: 99.8,24.97 102.5,24.97
  Top Layer w1.5: 102.5,24.97 106.1,28.57 106.1,35.29 M2.1
OUT_C: length 14.6
  Top Layer w1: Q1.3 101.6,40.11 101.6,30.66 M3.2
  Bottom Layer w1: M3.2 D1.2
PWMA_D5: length 12.1
  Top Layer w0.25: v2(75.37,3.9) U2.9 75.22,5.16 72.37,8.01 v2(71.97,8.01) ; v2(60.94,23.42) U3.1
PWMB_D6: length 8.4
  Top Layer w0.25: v2(84.47,4.53) 84.34,4.4 77.33,4.4 77.23,4.5 77.13,4.5 76.73,4.9 76.33,4.9
PWMC_D10: length 52.6
  Top Layer w0.25: 78.6,7.3 80.2,7.3 80.3,7.4 80.4,7.4 81.2,8.2 81.8,8.2 81.9,8.3 82,8.3 82.2,8.5 82.4,8.5 82.5,8.6 82.6,8.6 82.6,8.7 82.7,8.8 82.7,8.9 82.8,9 82.8,10 83.5,10.7 83.5,10.8 83.6,10.9 83.6,11.5 83.5,11.6 83.5,11.7 83.4,11.8 83.4,11.9 v2(83.2,12.1) ; v2(78,14.3) 78.3,14 v2(80.9,14) ; v2(85.2,22.7) 85.2,22.9 85.3,23 85.3,23.1 85.4,23.2 85.4,23.3 85.5,23.4 85.5,23.5 85.6,23.6 85.6,23.7 85.7,23.8 85.7,24 85.8,24.1 85.8,24.2 85.9,24.3 85.9,24.4 86,24.5 86,24.6 86.1,24.7 86.1,24.8 86.2,24.9 86.2,25.1 86.3,25.2 86.3,25.3 86.4,25.4 86.4,25.5 86.5,25.6 86.5,25.7 86.6,25.8 86.6,25.9 86.7,26 86.7,26.2 86.8,26.3 86.8,26.4 86.9,26.5 86.9,26.6 87,26.7 87,26.8 87.1,26.9 87.1,27 87.2,27.1 87.2,27.3 87.3,27.4 87.3,27.5 87.4,27.6 87.4,27.7 87.5,27.8 87.5,27.9 87.6,28 87.6,28.1 87.7,28.2 87.7,28.4 87.8,28.5 87.8,28.6 87.9,28.7 87.9,28.8 88,28.9 88,29 88.1,29.1 88.1,29.2 88.2,29.3 88.2,29.5 88.3,29.6 88.3,29.7 88.4,29.8 88.4,29.9 88.5,30 88.5,30.1 88.6,30.2 88.6,30.3 88.7,30.4 88.7,30.6 88.8,30.7 88.8,30.8 88.9,30.9 88.9,31 89,31.1 89,31.2 89.1,31.3 89.1,31.4 89.2,31.5 89.2,31.7 89.3,31.8 89.3,31.9 89.4,32 89.4,32.1 89.5,32.2 89.5,32.3 89.6,32.4 89.6,32.5 89.7,32.6 89.7,32.8 89.8,32.9 89.8,33 89.9,33.1 89.9,33.2 90,33.3 90,33.4 90.1,33.5 90.1,33.6 90.2,33.7 90.2,33.8 90.3,33.9 90.3,34.1 90.4,34.2 90.4,34.3 90.5,34.4 90.5,34.5 90.6,34.6 90.6,34.7 90.7,34.8 90.7,34.9 90.8,35 90.8,35.2 90.9,35.3 90.9,35.4 91,35.5 91,35.6 91.1,35.7 91.1,35.8 91.2,35.9 91.2,36 91.3,36.1 91.3,36.3 91.4,36.4 91.4,36.5 91.5,36.6 91.5,36.7 91.6,36.8 91.6,36.9 91.7,37 91.7,37.1 91.8,37.2 91.8,37.4 91.9,37.5 91.9,37.6 92,37.7 92,37.8 92.1,37.9 92.1,38 92.2,38.1 92.2,38.2 92.3,38.3 92.3,38.5 92.4,38.6 92.4,38.7 92.5,38.8 92.5,38.9 92.6,39 92.6,39.1 92.7,39.2 92.7,39.3 92.8,39.4 92.8,39.6 92.9,39.7 92.9,39.8 93,39.9 93,40 93.1,40.1 93.1,41.3 94.1,42.3 94.1,42.4 94.2,42.5 94.2,42.6 94.3,42.7 94.3,42.9 94.4,43 94.4,43.1 94.5,43.2 94.5,43.3 94.6,43.4 94.6,43.5 94.7,43.6 94.7,43.7 94.8,43.8 94.8,43.9 95.69,44.79 R16.1
  Bottom Layer w0.25: v2(78,14.3) 84.2,20.5 84.2,20.7 84.3,20.8 84.3,20.9 84.4,21 84.4,21.1 84.5,21.2 84.5,21.3 84.6,21.4 84.6,21.5 84.7,21.6 84.7,21.8 84.8,21.9 84.8,22 84.9,22.1 84.9,22.2 85,22.3 85,22.4 85.1,22.5 85.1,22.6 v2(85.2,22.7) ; v2(80.9,14) 82.8,12.1 v2(83.2,12.1)
RESET: length 73
  Top Layer w0.25: 85.63,10.5 90.43,10.5 90.9,10.03 v2(90.93,10.03) ; v2(69.78,15.8) 69.48,16.1 v2(63.98,16.1) ; v2(85.68,11.7) 85.68,11.2 85.32,10.84 C18.2 ; v2(72.13,11.85) 72.08,11.85 72.03,11.9 71.98,11.9 71.93,11.95 71.83,11.95 71.78,12 71.73,12 71.68,12.05 71.63,12.05 71.58,12.1 71.53,12.1 71.33,12.3 ; v2(98.68,14.1) v2(100.28,15.7) ; SW1.2 v2(98.56,2.39) ; v2(63.98,14.3) 63.93,14.25 R10.2 ; v2(101.98,19.4) v2(105.68,23.1) ; v2(70.62,12.82) 70.72,12.82 ; v2(74.38,9.6) v2(72.48,9.6)
  Bottom Layer w0.25: 74.88,10.3 73.88,11.3 73.88,12.8 72.88,13.8 72.68,13.8 71.38,15.1 70.48,15.1 69.98,15.6 ; v2(98.56,2.39) v2(90.93,10.03) ; v2(74.38,9.6) 74.38,9.65 74.93,10.2 ; v2(85.68,11.7) 85.18,11.2 v2(82.88,11.2) ; v2(105.68,23.1) 105.78,23.1 105.88,23.2 105.98,23.2 106.08,23.3 106.28,23.3 107.28,24.3 ; v2(98.68,14.1) 98.68,13.9 97.38,12.6 97.38,11.7 93.38,7.7 ; v2(101.98,19.4) 101.98,18.4 100.28,16.7 v2(100.28,15.7) ; v2(63.98,14.3) v2(63.98,16.1) ; 69.88,13.9 69.88,13.8 70.62,13.06 v2(70.62,12.82) ; v2(72.48,9.6) 72.48,9.7 72.43,9.75 72.43,9.8 72.38,9.85 72.38,9.9 72.33,9.95 72.33,10.05 72.28,10.1 72.28,10.15 72.23,10.2 72.23,10.25 72.18,10.3 72.18,10.35 72.13,10.4 v2(72.13,11.85)
RX_D0: length 81.8
  Top Layer w0.25: v2(58.4,19.8) 58.6,20 58.6,20.1 58.7,20.2 58.7,20.3 58.8,20.4 58.8,20.5 59.6,21.3 v2(80,21.3) ; v2(60.4,16.9) 61.9,15.4 61.9,15.3 62.1,15.1 62.2,15.1 62.3,15 65.4,15 66,14.4 66.1,14.4 66.2,14.3 67.6,14.3 68.5,13.4 68.6,13.4 68.7,13.3 69.1,13.3 69.6,12.8 ; v2(96.9,40.6) 93.6,37.3 93.6,37.2 93.5,37.1 93.5,35 93.3,34.8 93.3,34.7 93.2,34.6 93.2,34.5 v2(90.9,32.2) ; v2(73.15,11.1) 73,11.1 72.9,11.2 71.7,11.2 71.6,11.3 71.5,11.3 71.4,11.4 71.3,11.4 71.2,11.5 71.1,11.5 71,11.6 70.8,11.6 70.7,11.7
  Bottom Layer w0.25: v2(100.93,44.75) 100.02,45.66 R22.1 99.7,45.39 99.7,44.5 99.6,44.4 99.6,44.2 99.5,44.1 99.5,44 99.2,43.7 99.2,43.3 99.1,43.2 99.1,43.1 99,43 99,42.9 98.9,42.8 98.9,42.7 98.8,42.6 98.8,42.5 v2(96.9,40.6) ; v2(60.4,16.9) 60.4,17.8 v2(58.4,19.8) ; v2(80,21.3) v2(90.9,32.2) ; v2(73.15,11.1) 73.15,6.83 74.1,5.88 J3.3 74.68,3.85 74.68,3.8 74.75,3.8
S0_A0: length 43.2
  Top Layer w0.25: v2(77.03,15.95) 76.83,15.75 76.83,15.55 76.73,15.45 76.73,15.35 76.53,15.15 76.43,15.15 76.33,15.05 ; 83.23,55.05 83.23,35.85 83.33,35.75 83.33,35.45 83.43,35.35 83.43,35.05 83.53,34.95 83.53,34.25 83.63,34.15 83.63,31.05 83.53,30.95 83.53,30.85 83.43,30.75 83.43,30.55 83.33,30.45 83.33,30.15 83.23,30.05 83.23,29.85 83.13,29.75 83.13,29.55 83.03,29.45 83.03,29.25 82.93,29.15 82.93,29.05 82.83,28.95 82.83,28.75 82.73,28.65 82.73,28.55 82.63,28.45 82.63,28.35 82.43,28.15 82.43,28.05 82.33,27.95 82.33,27.85 82.13,27.65 82.13,27.55 81.93,27.35 81.93,27.25 81.83,27.15 81.83,27.05 81.73,26.95 81.73,26.85 81.63,26.75 81.63,26.65 81.53,26.55 81.53,26.45 81.43,26.35 81.43,26.15 81.33,26.05 81.33,25.95 81.23,25.85 81.23,25.75 81.13,25.65 81.13,25.55 81.03,25.45 81.03,25.35 80.93,25.25 80.93,25.05 80.83,24.95 80.83,24.85 80.73,24.75 80.73,24.65 80.63,24.55 80.63,24.45 80.53,24.35 80.53,24.25 80.43,24.15 80.43,23.95 80.33,23.85 80.33,23.75 80.23,23.65 80.23,23.55 80.13,23.45 80.13,23.35 80.03,23.25 80.03,23.15 79.93,23.05 79.93,22.95 79.83,22.85 v2(79.83,22.65)
  Bottom Layer w0.25: v2(79.83,22.65) 79.73,22.55 79.73,22.45 79.63,22.35 79.63,22.25 79.53,22.15 79.53,22.05 79.43,21.95 79.43,21.85 79.33,21.75 79.33,21.55 79.23,21.45 79.23,21.35 79.13,21.25 79.13,21.15 79.03,21.05 79.03,20.95 78.93,20.85 78.93,20.75 78.83,20.65 78.83,20.45 78.73,20.35 78.73,20.25 78.63,20.15 78.63,20.05 78.53,19.95 78.53,19.85 78.43,19.75 78.43,19.65 78.33,19.55 78.33,19.35 78.23,19.25 78.23,19.15 78.13,19.05 78.13,18.95 78.03,18.85 78.03,18.75 77.93,18.65 77.93,18.55 77.83,18.45 77.83,18.25 77.73,18.15 77.73,18.05 77.63,17.95 77.63,17.85 77.53,17.75 77.53,17.65 77.43,17.55 77.43,17.45 77.33,17.35 77.33,17.15 77.23,17.05 77.23,16.95 77.13,16.85 77.13,16.75 77.03,16.65 v2(77.03,15.95)
S1_A1: length 44.4
  Top Layer w0.25: 75.21,15.07 75.76,15.62 75.86,15.72 75.96,15.72 v2(76.16,15.92) ; 80.86,55.12 v2(80.86,40.12)
  Bottom Layer w0.25: v2(76.16,15.92) 76.16,16.52 76.26,16.62 76.26,16.82 76.36,16.92 76.36,17.02 76.46,17.12 76.46,17.22 76.56,17.32 76.56,17.42 76.66,17.52 76.66,17.62 76.76,17.72 76.76,17.92 76.86,18.02 76.86,18.12 76.96,18.22 76.96,18.32 77.06,18.42 77.06,18.52 77.16,18.62 77.16,18.72 77.26,18.82 77.26,19.02 77.36,19.12 77.36,19.22 77.46,19.32 77.46,19.42 77.56,19.52 77.56,19.62 77.66,19.72 77.66,19.82 77.76,19.92 77.76,20.12 77.86,20.22 77.86,20.32 77.96,20.42 77.96,20.52 78.06,20.62 78.06,20.72 78.16,20.82 78.16,20.92 78.26,21.02 78.26,21.22 78.36,21.32 78.36,21.42 78.46,21.52 78.46,21.62 78.56,21.72 78.56,21.82 78.66,21.92 78.66,22.02 78.76,22.12 78.76,22.32 78.86,22.42 78.86,22.52 78.96,22.62 78.96,22.72 79.06,22.82 79.06,22.92 79.16,23.02 79.16,23.12 79.26,23.22 79.26,23.42 79.36,23.52 79.36,23.62 79.46,23.72 79.46,23.82 79.56,23.92 79.56,24.02 79.66,24.12 79.66,24.22 79.76,24.32 79.76,24.42 79.86,24.52 79.86,24.72 79.96,24.82 79.96,24.92 80.06,25.02 80.06,25.12 80.16,25.22 80.16,25.32 80.26,25.42 80.26,25.52 80.36,25.62 80.36,25.82 80.46,25.92 80.46,26.02 80.56,26.12 80.56,26.22 80.66,26.32 80.66,26.42 80.76,26.52 80.76,26.62 80.86,26.72 80.86,26.92 80.96,27.02 80.96,27.12 81.36,27.52 81.36,27.62 81.56,27.82 81.56,27.92 81.76,28.12 81.76,28.22 81.96,28.42 81.96,28.52 82.06,28.62 82.06,28.72 82.16,28.82 82.16,28.92 82.26,29.02 82.26,29.12 82.36,29.22 82.36,29.32 82.46,29.42 82.46,29.62 82.56,29.72 82.56,29.92 82.66,30.02 82.66,30.22 82.76,30.32 82.76,30.52 82.86,30.62 82.86,30.92 82.96,31.02 82.96,31.52 83.06,31.62 83.06,31.72 83.16,31.82 83.16,33.32 83.06,33.42 83.06,34.42 82.96,34.52 82.96,34.92 82.86,35.02 82.86,35.32 82.76,35.42 82.76,35.72 82.66,35.82 82.66,36.02 82.56,36.12 82.56,36.32 82.46,36.42 82.46,36.52 82.36,36.62 82.36,36.72 82.26,36.82 82.26,37.02 82.16,37.12 82.16,37.22 81.96,37.42 81.96,37.52 81.86,37.62 81.86,37.72 81.66,37.92 81.66,38.02 81.46,38.22 81.46,38.32 81.26,38.52 81.26,38.62 80.86,39.02 v2(80.86,40.12)
S2_A2: length 45.8
  Top Layer w0.25: v2(73.03,15.93) 72.73,15.63 ; 78.13,55.03 78.13,41.83 80.83,39.13 80.83,39.03 81.33,38.53 81.33,38.43 81.53,38.23 81.53,38.13 81.73,37.93 81.73,37.83 81.93,37.63 81.93,37.53 82.03,37.43 82.03,37.33 82.13,37.23 82.13,37.13 82.23,37.03 82.23,36.93 82.33,36.83 82.33,36.73 82.43,36.63 82.43,36.43 82.53,36.33 82.53,36.23 82.63,36.13 82.63,35.93 82.73,35.83 82.73,35.53 82.83,35.43 82.83,35.13 82.93,35.03 82.93,34.73 83.03,34.63 83.03,33.93 83.13,33.83 83.13,32.23 83.03,32.13 83.03,31.43 82.93,31.33 82.93,30.93 82.83,30.83 82.83,30.53 82.73,30.43 82.73,30.23 82.63,30.13 82.63,29.93 82.53,29.83 82.53,29.63 82.43,29.53 82.43,29.43 82.33,29.33 82.33,29.13 82.23,29.03 82.23,28.93 82.13,28.83 82.13,28.73 81.93,28.53 81.93,28.43 81.83,28.33 81.83,28.23 81.63,28.03 81.63,27.93 81.43,27.73 81.43,27.63 81.13,27.33 81.13,27.23 v2(76.63,22.73)
  Bottom Layer w0.25: v2(73.03,15.93) 74.03,16.93 74.03,17.03 74.13,17.13 74.13,17.23 74.23,17.33 74.23,17.43 74.33,17.53 74.33,17.63 74.43,17.73 74.43,17.93 74.53,18.03 74.53,18.13 74.63,18.23 74.63,18.33 74.73,18.43 74.73,18.53 74.83,18.63 74.83,18.73 74.93,18.83 74.93,19.03 75.03,19.13 75.03,19.23 75.13,19.33 75.13,19.43 75.23,19.53 75.23,19.63 75.33,19.73 75.33,19.83 75.43,19.93 75.43,20.13 75.53,20.23 75.53,20.33 75.63,20.43 75.63,20.53 75.73,20.63 75.73,20.73 75.83,20.83 75.83,20.93 75.93,21.03 75.93,21.23 76.03,21.33 76.03,21.43 76.13,21.53 76.13,21.63 76.23,21.73 76.23,21.83 76.33,21.93 76.33,22.03 76.43,22.13 76.43,22.33 76.53,22.43 76.53,22.53 76.63,22.63 v2(76.63,22.73)
S3_A3: length 47.7
  Top Layer w0.25: U2.26 72.42,14.51 71.77,15.16 71.77,15.36 71.67,15.46 71.67,15.56 71.57,15.66 71.57,15.76 71.47,15.86 71.47,15.96 71.37,16.06 v2(71.37,16.26) ; 75.07,55.06 75.07,46.76 67.07,38.76 67.07,38.66 66.77,38.36 66.77,38.26 66.57,38.06 66.57,37.96 66.37,37.76 66.37,37.66 66.27,37.56 66.27,37.46 66.07,37.26 66.07,37.16 65.97,37.06 65.97,36.96 65.87,36.86 65.87,36.66 65.77,36.56 65.77,36.46 65.67,36.36 65.67,36.16 65.57,36.06 65.57,35.86 65.47,35.76 65.47,35.56 65.37,35.46 65.37,35.16 65.27,35.06 65.27,34.66 65.17,34.56 65.17,33.86 65.07,33.76 65.07,29.96 65.17,29.86 65.17,29.76 65.27,29.66 65.27,29.46 65.37,29.36 65.37,29.26 65.47,29.16 65.47,29.06 65.57,28.96 65.57,28.86 65.67,28.76 65.67,28.66 65.77,28.56 65.77,28.36 65.87,28.26 65.87,28.16 65.97,28.06 65.97,27.96 66.07,27.86 66.07,27.76 66.17,27.66 66.17,27.56 66.27,27.46 66.27,27.26 66.37,27.16 66.37,27.06 66.47,26.96 66.47,26.86 66.57,26.76 66.57,26.66 66.67,26.56 66.67,26.46 66.77,26.36 66.77,26.16 66.87,26.06 66.87,25.96 66.97,25.86 66.97,25.76 67.07,25.66 67.07,25.56 67.17,25.46 67.17,25.36 67.27,25.26 67.27,25.06 67.37,24.96 67.37,24.86 67.47,24.76 67.47,24.66 67.57,24.56 67.57,24.46 67.67,24.36 67.67,24.26 67.77,24.16 67.77,23.96 67.87,23.86 67.87,23.76 67.97,23.66 67.97,23.56 68.07,23.46 68.07,23.36 68.17,23.26 68.17,23.16 68.27,23.06 68.27,22.96 68.37,22.86 v2(68.37,22.66)
  Bottom Layer w0.25: v2(71.37,16.26) 71.27,16.36 71.27,16.46 71.17,16.56 71.17,16.66 71.07,16.76 71.07,16.86 70.97,16.96 70.97,17.06 70.87,17.16 70.87,17.36 70.77,17.46 70.77,17.56 70.67,17.66 70.67,17.76 70.57,17.86 70.57,17.96 70.47,18.06 70.47,18.16 70.37,18.26 70.37,18.46 70.27,18.56 70.27,18.66 70.17,18.76 70.17,18.86 70.07,18.96 70.07,19.06 69.97,19.16 69.97,19.26 69.87,19.36 69.87,19.56 69.77,19.66 69.77,19.76 69.67,19.86 69.67,19.96 69.57,20.06 69.57,20.16 69.47,20.26 69.47,20.36 69.37,20.46 69.37,20.66 69.27,20.76 69.27,20.86 69.17,20.96 69.17,21.06 69.07,21.16 69.07,21.26 68.97,21.36 68.97,21.46 68.87,21.56 68.87,21.76 68.77,21.86 68.77,21.96 68.67,22.06 68.67,22.16 68.57,22.26 68.57,22.36 68.47,22.46 68.47,22.56 v2(68.37,22.66)
TX_D1: length 90.6
  Top Layer w0.25: 66.31,12.7 66.31,13.2 66.61,13.5 67.31,13.5 67.41,13.4 67.51,13.4 68.71,12.2 69.01,12.2 ; LED5.1 66.01,12.4 v2(64.91,13.5) ; v2(70.41,10.73) 70.31,10.83 70.31,10.93 70.11,11.13 ; v2(85.61,25.4) 85.91,25.7 85.91,25.8 86.01,25.9 86.01,26 86.11,26.1 86.11,26.2 86.21,26.3 86.21,26.5 86.31,26.6 86.31,26.7 86.41,26.8 86.41,26.9 86.51,27 86.51,27.1 86.61,27.2 86.61,27.3 86.71,27.4 86.71,27.6 86.81,27.7 86.81,27.8 86.91,27.9 86.91,28 87.01,28.1 87.01,28.2 87.11,28.3 87.11,28.4 87.21,28.5 87.21,28.7 87.31,28.8 87.31,28.9 87.41,29 87.41,29.1 87.51,29.2 87.51,29.3 87.61,29.4 87.61,29.5 87.71,29.6 87.71,29.8 87.81,29.9 87.81,30 87.91,30.1 87.91,30.2 88.01,30.3 88.01,30.4 88.11,30.5 88.11,30.6 88.21,30.7 88.21,30.9 88.31,31 88.31,31.1 88.41,31.2 88.41,31.3 88.51,31.4 88.51,31.5 88.61,31.6 88.61,31.7 88.71,31.8 88.71,32 88.81,32.1 88.81,32.2 88.91,32.3 88.91,32.4 89.01,32.5 89.01,32.6 89.11,32.7 89.11,32.8 89.21,32.9 89.21,33.1 89.31,33.2 89.31,33.3 89.41,33.4 89.41,33.5 89.51,33.6 89.51,33.7 89.61,33.8 89.61,33.9 89.71,34 89.71,34.1 89.81,34.2 89.81,34.4 89.91,34.5 89.91,34.6 90.01,34.7 90.01,34.8 90.11,34.9 90.11,35 90.21,35.1 90.21,35.2 90.31,35.3 90.31,35.5 90.41,35.6 90.41,35.7 90.51,35.8 90.51,35.9 90.61,36 90.61,36.1 90.71,36.2 90.71,36.3 90.81,36.4 90.81,36.6 90.91,36.7 90.91,36.8 91.01,36.9 91.01,37 91.11,37.1 91.11,37.2 91.21,37.3 91.21,37.4 91.31,37.5 91.31,37.7 91.41,37.8 91.41,37.9 91.51,38 91.51,38.1 91.61,38.2 91.61,38.3 91.71,38.4 91.71,38.5 91.81,38.6 91.81,38.8 91.91,38.9 91.91,39 92.01,39.1 92.01,39.2 92.11,39.3 92.11,39.4 92.21,39.5 92.21,39.6 92.31,39.7 92.31,39.9 92.41,40 92.41,40.1 92.51,40.2 v2(92.51,41.6) ; v2(63.31,16.7) 65.41,18.8 v2(85.61,18.8) 85.78,18.63 86.21,18.63 88.61,16.23 88.71,16.23 88.91,16.03 89.01,16.03 v2(89.81,15.23) ; v2(73.91,8.93) v2(71.21,8.93)
  Bottom Layer w0.25: v2(64.91,13.5) 64.81,13.6 63.61,13.6 63.31,13.9 v2(63.31,16.7) ; v2(80.11,18.9) 80.91,19.7 80.91,19.8 81.01,19.9 81.01,20 81.11,20.1 81.11,20.2 81.21,20.3 81.21,20.5 81.31,20.6 81.31,20.7 81.41,20.8 81.41,20.9 81.51,21 81.51,21.1 81.61,21.2 81.61,21.3 81.71,21.4 81.71,21.5 v2(85.61,25.4) ; v2(84.81,11.83) 84.81,18 v2(85.61,18.8) ; v2(71.21,8.93) 71.21,9.03 71.11,9.13 71.11,9.23 71.01,9.33 71.01,9.43 70.91,9.53 70.91,9.63 70.81,9.73 70.81,9.83 70.71,9.93 70.71,10.13 70.61,10.23 70.61,10.33 70.51,10.43 70.51,10.53 70.41,10.63 v2(70.41,10.73) ; v2(92.51,41.6) 94.81,41.6 96.41,40 96.51,40 96.61,39.9 99.61,39.9 99.71,40 ; 71.11,5.5 71.11,8.7
VCP_A: length 3.6
  Top Layer w0.25: C11.2 52.23,14.25 52.18,14.3 52.18,14.4 52.13,14.45 52.13,14.5 52.08,14.55 52.08,14.6 52.03,14.65 52.03,14.7 51.98,14.75 51.98,14.85 51.93,14.9 51.93,17.7 U3.12
VCP_B: length 3.4
  Top Layer w0.25: 96.13,26.21 96.13,26.22 96.18,26.17 96.18,26.07 97.33,24.92 97.33,23.57 97.38,23.52 97.38,23.47 U4.12
VREF: length 69
  Top Layer w0.25: 90.94,21.86 91.14,21.66 91.24,21.66 91.34,21.56 91.44,21.56 91.54,21.46 91.64,21.46 91.74,21.36 91.84,21.36 91.94,21.26 92.14,21.26 92.24,21.16 92.34,21.16 92.44,21.06 92.54,21.06 92.64,20.96 92.74,20.96 92.84,20.86 92.94,20.86 93.04,20.76 93.24,20.76 93.34,20.66 93.44,20.66 93.54,20.56 93.64,20.56 93.74,20.46 93.84,20.46 93.94,20.36 94.04,20.36 94.14,20.26 94.24,20.26 v2(94.44,20.06) ; v2(99.35,19.06) 99.23,18.94 97.92,18.94 97.43,18.44 U4.5 ; 94.94,11.96 97.84,11.96 98.05,12.16 v2(98.05,12.16) R11.2 ; U3.5 51.93,23.74 51.87,23.8 51.87,24.12 52.16,24.41 52.16,27.16 52.71,27.71 59.23,27.71 64.96,21.97 v2(90.73,21.97)
  Bottom Layer w0.25: v2(94.44,20.06) 94.44,19.86 95.14,19.16 99.14,19.16 ; v2(98.05,12.16) 99.35,13.47 v2(99.35,19.06)
XTAL1: length 17.1
  Top Layer w0.25: U2.7 72.44,5.49 72.59,5.49 72.75,5.64 72.79,5.64 73.04,5.89 73.09,5.89 73.14,5.94 73.29,5.94 73.34,5.99 73.69,5.99 73.94,5.74 73.94,5.69 74,5.64 74,5.54 74.04,5.49 74.04,5.24 74,5.19 74,5.09 73.94,5.04 73.94,4.99 72.89,3.94 72.79,3.94 72.75,3.89 70.75,3.89 70.69,3.84 66.79,3.84 66.75,3.89 66.69,3.89 66.25,4.34 66.19,4.34 66.14,4.39 66.09,4.39 66.04,4.44 65.94,4.44 65.89,4.49 65.84,4.49 65.79,4.54 65.75,4.54 65.69,4.59 65.64,4.59 65.59,4.64 65.54,4.64 65.5,4.69 65.39,4.69 65.34,4.74 65.29,4.74 65.25,4.79 65.19,4.79 65.14,4.84 65.09,4.84 65.04,4.89 65,4.89 64.94,4.94 64.84,4.94 64.79,4.99 64.75,4.99 64.69,5.04 64.64,5.04 64.59,5.09 64.54,5.09 64.5,5.14 64.44,5.14 64.39,5.19 64.29,5.19 64.25,5.24 64.19,5.24 64.14,5.29 64.09,5.29 64.04,5.34 64,5.34 63.94,5.39 63.84,5.39 X1.1 63.79,8.54 C9.1
XTAL2: length 9.3
  Top Layer w0.25: C10.1 66.73,8.54 66.78,8.49 66.78,8.39 66.83,8.34 66.83,8.29 66.88,8.24 66.88,8.19 66.93,8.14 66.93,8.09 66.98,8.04 66.98,7.94 67.03,7.89 67.03,7.84 67.83,7.04 67.83,6.09 67.88,6.04 67.88,5.44 X1.2 67.89,5.43 67.94,5.38 68.04,5.38 68.09,5.33 68.14,5.33 68.19,5.28 68.25,5.28 68.29,5.23 68.34,5.23 68.39,5.18 68.5,5.18 68.54,5.13 68.59,5.13 68.64,5.08 68.69,5.08 68.75,5.03 68.79,5.03 68.84,4.98 68.89,4.98 68.94,4.93 69.04,4.93 69.09,4.88 69.14,4.88 69.19,4.83 69.25,4.83 69.29,4.78 69.34,4.78 69.39,4.73 69.44,4.73 69.5,4.68 69.59,4.68 69.64,4.63 69.69,4.63 69.75,4.58 69.79,4.58 69.84,4.53 69.89,4.53 69.94,4.48 72.25,4.48 72.29,4.53 72.34,4.53 72.59,4.78 72.69,4.78 72.84,4.93 73,4.93 72.99,4.93
$1N2048: length 0.9
  Bottom Layer w0.25: 8.3,36.28 7.4,36.28
$1N2069: length 5.4
  Bottom Layer w0.25: 139.92,38 140.12,38 140.52,37.6 143.32,37.6 143.42,37.5 143.52,37.5 143.62,37.4 143.82,37.4 143.92,37.3 144.02,37.3 144.12,37.2 144.22,37.2 144.32,37.1 144.42,37.1 144.52,37 144.72,37 144.82,36.9
$1N2070: length 4.4
  Top Layer w0.25: 49.85,45.62 50.05,45.62 50.55,45.12 52.85,45.12 52.95,45.22 53.05,45.22 53.15,45.32 53.25,45.32 53.35,45.42 53.45,45.42 53.55,45.52 53.75,45.52 53.85,45.62
$1N2073: length 10.6
  Top Layer w0.25: LED2.2 5.5,38.3 5.5,37 10.3,37 10.4,37.1 10.5,37.1 10.6,37.2 10.7,37.2 10.8,37.3 11,37.3 11.1,37.4 11.2,37.4 11.3,37.5 11.4,37.5 11.5,37.6 v2(13.2,37.6)
  Bottom Layer w0.25: v2(13.2,37.6) 13.1,37.7 12.9,37.7 12.8,37.8
$1N2082: length 7.9
  Top Layer w0.25: 143.2,37.91 137.4,37.91 136.9,37.41
  Bottom Layer w0.25: R9.2 136.59,36.82 136.59,37.4 v2(136.6,37.41)
$1N2129: length 1.3
  Top Layer w0.25: 93.42,46.49 93.42,45.19
$1N2130: length 2.8
  Top Layer w0.25: 64.08,11.97 61.28,11.97
$1N2219: length 4.9
  Top Layer w0.25: 95.32,42.99 95.32,40.99 ; 95.82,40.99 96.12,41.29 98.62,41.29
